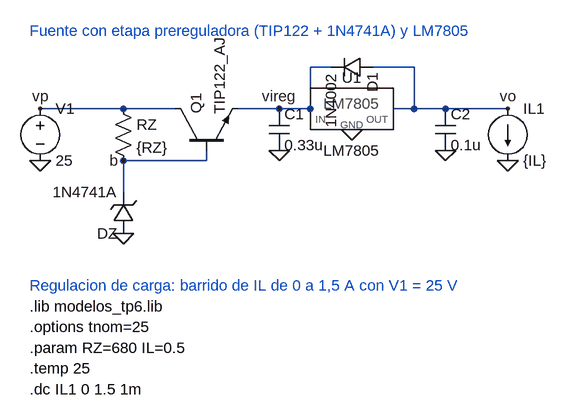
[diagram p0: schematic c6_carga.asc]
c6_carga.asc, the LTspice schematic file:
Version 4
SHEET 1 1200 720
WIRE 32 96 160 96
WIRE 160 96 240 96
WIRE 160 176 160 224
WIRE 288 160 288 176
WIRE 288 176 160 176
WIRE 336 96 400 96
WIRE 400 96 448 96
WIRE 480 32 448 32
WIRE 448 32 448 96
WIRE 544 32 608 32
WIRE 608 32 608 96
WIRE 576 96 608 96
WIRE 608 96 656 96
WIRE 656 96 752 96
FLAG 32 176 0
FLAG 32 96 vp
FLAG 160 288 0
FLAG 160 176 b
FLAG 400 96 vireg
FLAG 400 160 0
FLAG 512 128 0
FLAG 656 160 0
FLAG 752 176 0
FLAG 752 96 vo
SYMBOL voltage 32 80 R0
SYMATTR InstName V1
SYMATTR Value 25
SYMBOL res 144 80 R0
SYMATTR InstName RZ
SYMATTR Value {RZ}
SYMBOL zener 176 288 R180
SYMATTR InstName DZ
SYMATTR Value 1N4741A
SYMBOL npn 240 160 R270
SYMATTR InstName Q1
SYMATTR Value TIP122_AJ
SYMATTR Prefix X
SYMBOL cap 384 96 R0
SYMATTR InstName C1
SYMATTR Value 0.33u
SYMBOL LM7805 512 96 R0
SYMATTR InstName U1
SYMATTR Value LM7805
SYMBOL diode 544 16 R90
SYMATTR InstName D1
SYMATTR Value 1N4002
SYMBOL cap 640 96 R0
SYMATTR InstName C2
SYMATTR Value 0.1u
SYMBOL current 752 96 R0
SYMATTR InstName IL1
SYMATTR Value {IL}
TEXT 16 -24 Left 2 ;Fuente con etapa prereguladora (TIP122 + 1N4741A) y LM7805
TEXT 16 400 Left 2 !.lib modelos_tp6.lib
TEXT 16 432 Left 2 !.options tnom=25
TEXT 16 464 Left 2 !.param RZ=680 IL=0.5
TEXT 16 496 Left 2 !.temp 25
TEXT 16 528 Left 2 !.dc IL1 0 1.5 1m
TEXT 16 368 Left 2 ;Regulacion de carga: barrido de IL de 0 a 1,5 A con V1 = 25 V

The netlist it stands for:
* c6_carga.asc
V1 vp 0 25
RZ vp b {RZ}
DZ 0 b 1N4741A
XQ1 vp b vireg TIP122_AJ  ; pins C B E
C1 vireg 0 0.33u
XU1 vireg 0 vo LM7805  ; pins IN GND OUT
D1 vo vireg 1N4002
C2 vo 0 0.1u
IL1 vo 0 {IL}
.model D D
.lib standard.dio
* Fuente con etapa prereguladora (TIP122 + 1N4741A) y LM7805
.lib modelos_tp6.lib
.options tnom=25
.param RZ=680 IL=0.5
.temp 25
.dc IL1 0 1.5 1m
* Regulacion de carga: barrido de IL de 0 a 1,5 A con V1 = 25 V
.backanno
.end